# Altium schematic sheet 11_DIGITAL_OUTPUTS.SchDoc
size A3
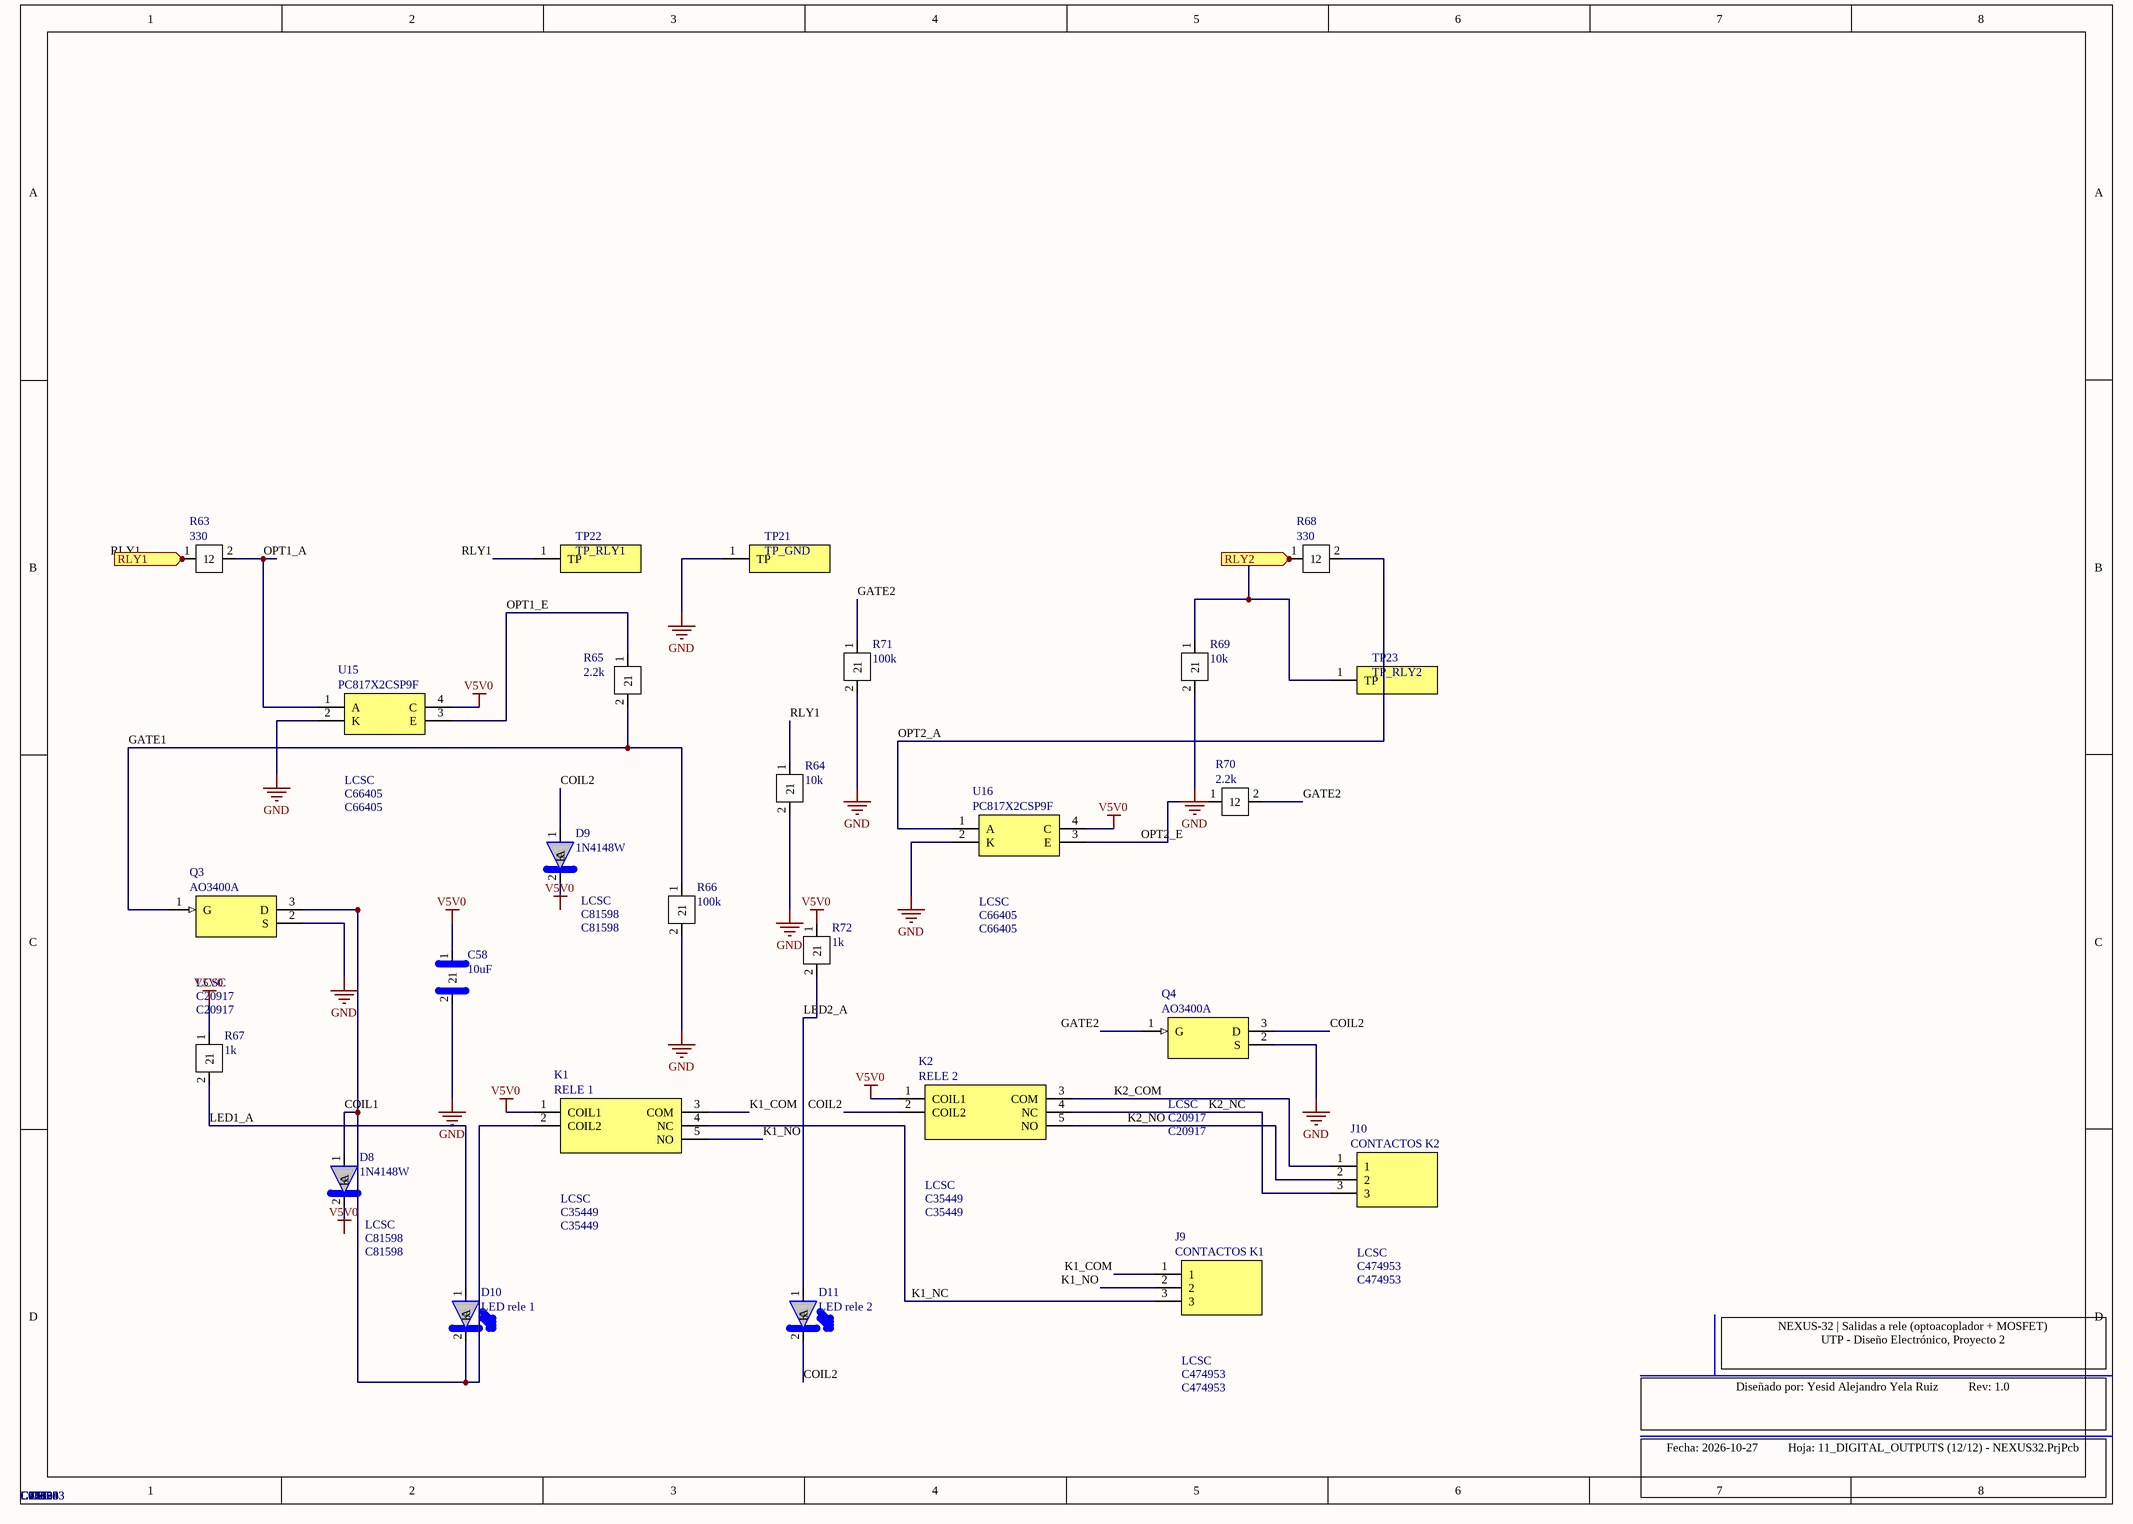
[diagram p0: 11_DIGITAL_OUTPUTS.SchDoc]

## Parts
C58  10uF  Supplier 1: LCSC  Supplier Part Number 1: C1713  [C_0805]
D8  1N4148W  Supplier 1: LCSC  Supplier Part Number 1: C81598  [D_SOD-123]
D9  1N4148W  Supplier 1: LCSC  Supplier Part Number 1: C81598  [D_SOD-123]
D10  LED rele 1  Supplier 1: LCSC  Supplier Part Number 1: C12624  [LED_0603]
D11  LED rele 2  Supplier 1: LCSC  Supplier Part Number 1: C965803  [LED_0603]
J9  CONTACTOS K1  Supplier 1: LCSC  Supplier Part Number 1: C474953  [TB_KF128-5.08-3P]
J10  CONTACTOS K2  Supplier 1: LCSC  Supplier Part Number 1: C474953  [TB_KF128-5.08-3P]
K1  RELE 1  Supplier 1: LCSC  Supplier Part Number 1: C35449  [RELAY_SRD-05VDC-SL-C]
K2  RELE 2  Supplier 1: LCSC  Supplier Part Number 1: C35449  [RELAY_SRD-05VDC-SL-C]
Q3  AO3400A  Supplier 1: LCSC  Supplier Part Number 1: C20917  [SOT-23-3_DBZ]
Q4  AO3400A  Supplier 1: LCSC  Supplier Part Number 1: C20917  [SOT-23-3_DBZ]
R63  330  Supplier 1: LCSC  Supplier Part Number 1: C23138  [R_0603]
R64  10k  Supplier 1: LCSC  Supplier Part Number 1: C25804  [R_0603]
R65  2.2k  Supplier 1: LCSC  Supplier Part Number 1: C4190  [R_0603]
R66  100k  Supplier 1: LCSC  Supplier Part Number 1: C25803  [R_0603]
R67  1k  Supplier 1: LCSC  Supplier Part Number 1: C21190  [R_0603]
R68  330  Supplier 1: LCSC  Supplier Part Number 1: C23138  [R_0603]
R69  10k  Supplier 1: LCSC  Supplier Part Number 1: C25804  [R_0603]
R70  2.2k  Supplier 1: LCSC  Supplier Part Number 1: C4190  [R_0603]
R71  100k  Supplier 1: LCSC  Supplier Part Number 1: C25803  [R_0603]
R72  1k  Supplier 1: LCSC  Supplier Part Number 1: C21190  [R_0603]
TP21  TP_GND  [TP_PAD_1.5mm]
TP22  TP_RLY1  [TP_PAD_1.5mm]
TP23  TP_RLY2  [TP_PAD_1.5mm]
U15  PC817X2CSP9F  Supplier 1: LCSC  Supplier Part Number 1: C66405  [SOP-4_PC817X_L10.16]
U16  PC817X2CSP9F  Supplier 1: LCSC  Supplier Part Number 1: C66405  [SOP-4_PC817X_L10.16]

## Ports
RLY1 (in), RLY2 (in)

## Nets
GND: C58.2 Q3.2(S) Q4.2(S) R64.2 R66.2 R69.2 R71.2 TP21.1(TP) U15.2(K) U16.2(K)
V5V0: C58.1 D8.2(K) D9.2(K) K1.1(COIL1) K2.1(COIL1) R67.1 R72.1 U15.4(C) U16.4(C)
COIL1: D8.1(A) D10.2(K) K1.2(COIL2) Q3.3(D)
COIL2: D9.1(A) D11.2(K) K2.2(COIL2) Q4.3(D)
GATE1: Q3.1(G) R65.2 R66.1
GATE2: Q4.1(G) R70.2 R71.1
K1_COM: J9.1 K1.3(COM)
K1_NC: J9.3 K1.4(NC)
K1_NO: J9.2 K1.5(NO)
K2_COM: J10.1 K2.3(COM)
K2_NC: J10.3 K2.4(NC)
K2_NO: J10.2 K2.5(NO)
LED1_A: D10.1(A) R67.2
LED2_A: D11.1(A) R72.2
OPT1_A: R63.2 U15.1(A)
OPT1_E: R65.1 U15.3(E)
OPT2_A: R68.2 U16.1(A)
OPT2_E: R70.1 U16.3(E)
RLY1: R63.1 R64.1 TP22.1(TP) ; port RLY1
RLY2: R68.1 R69.1 TP23.1(TP) ; port RLY2

## Notes on the sheet
- NEXUS-32 | Salidas a rele (optoacoplador + MOSFET)
  UTP - Diseño Electrónico, Proyecto 2
- Diseñado por: Yesid Alejandro Yela Ruiz          Rev: 1.0
- Fecha: 2026-10-27          Hoja: 11_DIGITAL_OUTPUTS (12/12) - NEXUS32.PrjPcb

## Library data of the parts
C58 = CAP_0805: Condensador ceramico SMD 0603; Manufacturer: Samsung; Manufacturer Part Number: CL21A106KOQNNNE; Datasheet: https://wmsc.lcsc.com/wmsc/upload/file/pdf/v2/lcsc/2206010045_UNI-ROYAL-Uniroyal-Elec-0603WAF1002T5E_C25804.pdf; LCSC Part #: C1713
D8 D9 = 1N4148W: Diodo de conmutacion 75V 150mA SOD-123 (Semtech 1N4148W); Manufacturer: Semtech; Manufacturer Part Number: 1N4148W; LCSC Part #: C81598; Datasheet: https://wmsc.lcsc.com/wmsc/upload/file/pdf/v2/lcsc/1811061725_ST-Semtech-1N4148W_C81598.pdf
D10 = LED_0603: LED SMD 0603; Manufacturer: Hubei KENTO; Manufacturer Part Number: KT-0603G; Datasheet: https://wmsc.lcsc.com/wmsc/upload/file/pdf/v2/lcsc/2206010045_UNI-ROYAL-Uniroyal-Elec-0603WAF1002T5E_C25804.pdf; LCSC Part #: C12624
D11 = LED_0603: LED SMD 0603; Manufacturer: XINGLIGHT; Manufacturer Part Number: XL-1608UYC-04; Datasheet: https://wmsc.lcsc.com/wmsc/upload/file/pdf/v2/lcsc/2206010045_UNI-ROYAL-Uniroyal-Elec-0603WAF1002T5E_C25804.pdf; LCSC Part #: C965803
J9 J10 = KF128-5.08-3P-AA: Bornera tornillo 3 polos paso 5.08mm (Cixi Kefa KF128-5.08-3P-AA); Manufacturer: Cixi Kefa Electronics (KEFA); Manufacturer Part Number: KF128-5.08-3P-AA; LCSC Part #: C474953; Datasheet: https://wmsc.lcsc.com/wmsc/upload/file/pdf/v2/lcsc/2408211511_Cixi-Kefa-Elec-KF128-5-08-3P-AA_C474953.pdf
K1 K2 = SRD-05VDC-SL-C: Rele SPDT 5V bobina 70 ohm (Songle SRD-05VDC-SL-C); 1-2 bobina, 3 COM, 4 NC, 5 NO; Manufacturer: Songle Relay; Manufacturer Part Number: SRD-05VDC-SL-C; LCSC Part #: C35449; Datasheet: https://wmsc.lcsc.com/wmsc/upload/file/pdf/v2/lcsc/2304140030_Ningbo-Songle-Relay-SRD-05VDC-SL-C_C35449.pdf
Q3 Q4 = AO3400A: MOSFET canal N 30V 5.7A SOT-23 (Alpha and Omega AO3400A); Manufacturer: Alpha & Omega Semiconductor; Manufacturer Part Number: AO3400A; LCSC Part #: C20917; Datasheet: https://wmsc.lcsc.com/wmsc/upload/file/pdf/v2/lcsc/1811081213_Alpha---Omega-Semicon-AO3400A_C20917.pdf
R63 R68 = RES_0603: Resistencia SMD 0603; Manufacturer: UNI-ROYAL; Manufacturer Part Number: 0603WAF3300T5E; Datasheet: https://wmsc.lcsc.com/wmsc/upload/file/pdf/v2/lcsc/2206010045_UNI-ROYAL-Uniroyal-Elec-0603WAF1002T5E_C25804.pdf; LCSC Part #: C23138
R64 R69 = RES_0603: Resistencia SMD 0603; Manufacturer: UNI-ROYAL; Manufacturer Part Number: 0603WAF1002T5E; Datasheet: https://wmsc.lcsc.com/wmsc/upload/file/pdf/v2/lcsc/2206010045_UNI-ROYAL-Uniroyal-Elec-0603WAF1002T5E_C25804.pdf; LCSC Part #: C25804
R65 R70 = RES_0603: Resistencia SMD 0603; Manufacturer: UNI-ROYAL; Manufacturer Part Number: 0603WAF2201T5E; Datasheet: https://wmsc.lcsc.com/wmsc/upload/file/pdf/v2/lcsc/2206010045_UNI-ROYAL-Uniroyal-Elec-0603WAF1002T5E_C25804.pdf; LCSC Part #: C4190
R66 R71 = RES_0603: Resistencia SMD 0603; Manufacturer: UNI-ROYAL; Manufacturer Part Number: 0603WAF1003T5E; Datasheet: https://wmsc.lcsc.com/wmsc/upload/file/pdf/v2/lcsc/2206010045_UNI-ROYAL-Uniroyal-Elec-0603WAF1002T5E_C25804.pdf; LCSC Part #: C25803
R67 R72 = RES_0603: Resistencia SMD 0603; Manufacturer: UNI-ROYAL; Manufacturer Part Number: 0603WAF1001T5E; Datasheet: https://wmsc.lcsc.com/wmsc/upload/file/pdf/v2/lcsc/2206010045_UNI-ROYAL-Uniroyal-Elec-0603WAF1002T5E_C25804.pdf; LCSC Part #: C21190
TP21-TP23 = TESTPOINT: Punto de prueba, pad desnudo de 1.5mm sin montaje; Manufacturer: n/a; Manufacturer Part Number: TP_PAD_1.5mm; Datasheet: https://wmsc.lcsc.com/wmsc/upload/file/pdf/v2/lcsc/2206010045_UNI-ROYAL-Uniroyal-Elec-0603WAF1002T5E_C25804.pdf
U15 U16 = PC817X2CSP9F: Optoacoplador fototransistor 5kV SMD-4 (Sharp PC817X2CSP9F); Manufacturer: Sharp; Manufacturer Part Number: PC817X2CSP9F; LCSC Part #: C66405; Datasheet: https://wmsc.lcsc.com/wmsc/upload/file/pdf/v2/lcsc/2304140030_Sharp-Microelectronics-PC817X2CSP9F_C66405.pdf